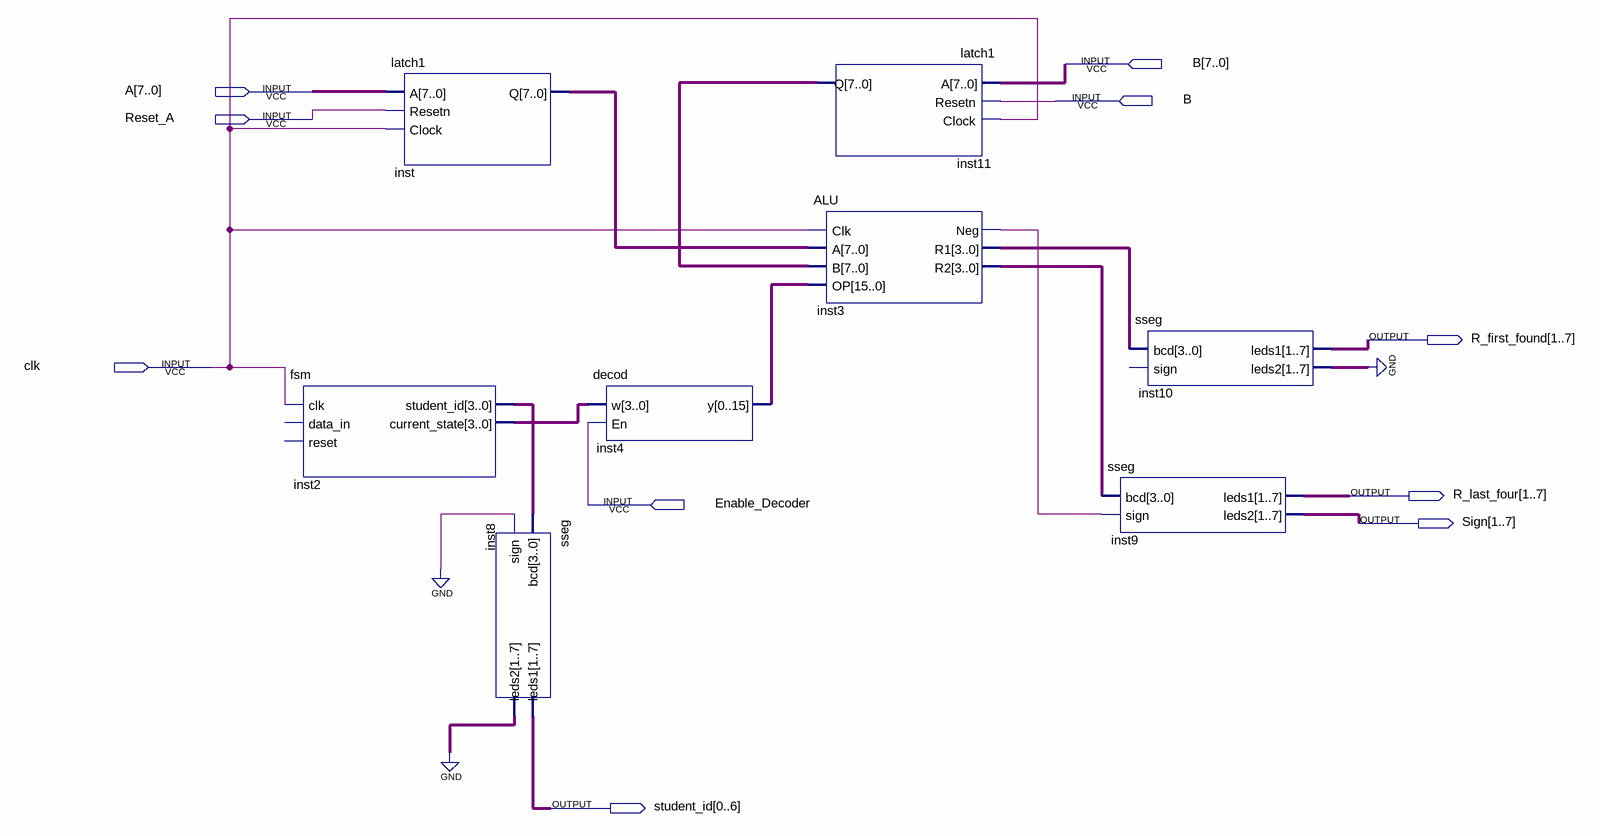
[diagram p0: schematic sheet]
// Quartus schematic combined.bdf as structural Verilog: 8 symbols, 10 pins
module combined (
  input  [7:0] B,
  input  [7:0] A,
  input  B_1bit,
  input  Reset_A,
  input  clk,
  input  Enable_Decoder,
  output [1:7] R_first_found,
  output [1:7] R_last_four,
  output [1:7] Sign,
  output [0:6] student_id
);

  wire inst3_neg;
  wire [3:0] inst2_current_state, inst2_student_id, inst3_r1, inst3_r2;
  wire [6:0] inst8_leds2, inst10_leds2;
  wire [7:0] inst11_q, inst_q;
  wire [15:0] inst4_y;

  fsm inst2 (.clk(clk), .student_id(inst2_student_id), .current_state(inst2_current_state));  // open: data_in, reset
  latch1 inst (.A(A), .Resetn(Reset_A), .Clock(clk), .Q(inst_q));
  sseg inst8 (.bcd(inst2_student_id), .sign(1'b0), .leds1(student_id), .leds2(inst8_leds2));
  decod inst4 (.w(inst2_current_state), .En(Enable_Decoder), .y(inst4_y));
  latch1 inst11 (.A(B), .Resetn(B_1bit), .Clock(clk), .Q(inst11_q));
  ALU inst3 (.Clk(clk), .A(inst_q), .B(inst11_q), .OP(inst4_y), .Neg(inst3_neg), .R1(inst3_r1), .R2(inst3_r2));
  sseg inst9 (.bcd(inst3_r2), .sign(inst3_neg), .leds1(R_last_four), .leds2(Sign));
  sseg inst10 (.bcd(inst3_r1), .leds1(R_first_found), .leds2(inst10_leds2));  // open: sign
  // also tied to GND on the sheet: {inst8_leds2[0], inst8_leds2[1], inst8_leds2[2], inst8_leds2[3], inst8_leds2[4], inst8_leds2[5], inst8_leds2[6], inst10_leds2[0], inst10_leds2[1], inst10_leds2[2], inst10_leds2[3], inst10_leds2[4], inst10_leds2[5], inst10_leds2[6]}
endmodule
